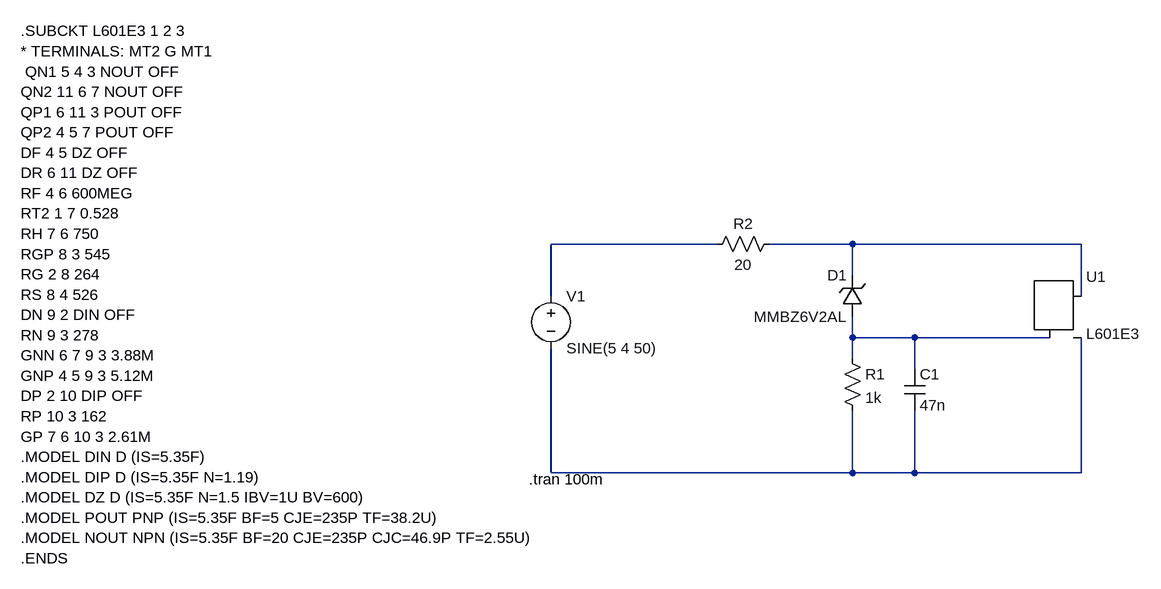
[diagram p0: schematic crawbar.asc]
crawbar.asc, the LTspice schematic file:
Version 4
SHEET 1 5784 680
WIRE -64 48 -320 48
WIRE 144 48 16 48
WIRE 496 48 144 48
WIRE 144 96 144 48
WIRE -320 128 -320 48
WIRE 496 128 496 48
WIRE 144 192 144 160
WIRE 240 192 144 192
WIRE 448 192 240 192
WIRE 144 224 144 192
WIRE 240 240 240 192
WIRE -320 400 -320 208
WIRE 144 400 144 304
WIRE 144 400 -320 400
WIRE 240 400 240 304
WIRE 240 400 144 400
WIRE 496 400 496 192
WIRE 496 400 240 400
SYMBOL zener 160 160 R180
WINDOW 0 24 64 Left 2
WINDOW 3 24 0 Left 2
SYMATTR InstName D1
SYMATTR Value MMBZ6V2AL
SYMBOL res 128 208 R0
SYMATTR InstName R1
SYMATTR Value 1k
SYMBOL res 32 32 R90
WINDOW 0 0 56 VBottom 2
WINDOW 3 32 56 VTop 2
SYMATTR InstName R2
SYMATTR Value 20
SYMBOL cap 224 240 R0
SYMATTR InstName C1
SYMATTR Value 47n
SYMBOL voltage -320 112 R0
WINDOW 123 0 0 Left 0
WINDOW 39 0 0 Left 0
SYMATTR InstName V1
SYMATTR Value SINE(5 4 50)
SYMBOL Misc\\TRIAC 464 128 R0
SYMATTR InstName U1
SYMATTR Value L601E3
SYMATTR SpiceModel L601E3
TEXT -354 410 Left 2 !.tran 100m
TEXT -1136 -280 Left 2 !.SUBCKT L601E3 1 2 3 \n* TERMINALS: MT2 G MT1\n QN1 5 4 3 NOUT OFF \nQN2 11 6 7 NOUT OFF \nQP1 6 11 3 POUT OFF \nQP2 4 5 7 POUT OFF \nDF 4 5 DZ OFF \nDR 6 11 DZ OFF \nRF 4 6 600MEG \nRT2 1 7 0.528 \nRH 7 6 750 \nRGP 8 3 545 \nRG 2 8 264 \nRS 8 4 526 \nDN 9 2 DIN OFF \nRN 9 3 278 \nGNN 6 7 9 3 3.88M \nGNP 4 5 9 3 5.12M \nDP 2 10 DIP OFF \nRP 10 3 162 \nGP 7 6 10 3 2.61M \n.MODEL DIN D (IS=5.35F) \n.MODEL DIP D (IS=5.35F N=1.19) \n.MODEL DZ D (IS=5.35F N=1.5 IBV=1U BV=600) \n.MODEL POUT PNP (IS=5.35F BF=5 CJE=235P TF=38.2U) \n.MODEL NOUT NPN (IS=5.35F BF=20 CJE=235P CJC=46.9P TF=2.55U) \n.ENDS

The netlist it stands for:
* crawbar.asc
D1 N003 N002 MMBZ6V2AL
R1 N003 N004 1k
R2 N002 N001 20
C1 N003 N004 47n
V1 N001 N004 SINE(5 4 50)
XU1 N002 N003 N004 L601E3 L601E3  ; pins MT2 G MT1
.model D D
.lib standard.dio
.tran 100m
.SUBCKT L601E3 1 2 3
* TERMINALS: MT2 G MT1
 QN1 5 4 3 NOUT OFF
QN2 11 6 7 NOUT OFF
QP1 6 11 3 POUT OFF
QP2 4 5 7 POUT OFF
DF 4 5 DZ OFF
DR 6 11 DZ OFF
RF 4 6 600MEG
RT2 1 7 0.528
RH 7 6 750
RGP 8 3 545
RG 2 8 264
RS 8 4 526
DN 9 2 DIN OFF
RN 9 3 278
GNN 6 7 9 3 3.88M
GNP 4 5 9 3 5.12M
DP 2 10 DIP OFF
RP 10 3 162
GP 7 6 10 3 2.61M
.MODEL DIN D (IS=5.35F)
.MODEL DIP D (IS=5.35F N=1.19)
.MODEL DZ D (IS=5.35F N=1.5 IBV=1U BV=600)
.MODEL POUT PNP (IS=5.35F BF=5 CJE=235P TF=38.2U)
.MODEL NOUT NPN (IS=5.35F BF=20 CJE=235P CJC=46.9P TF=2.55U)
.ENDS
.backanno
.end